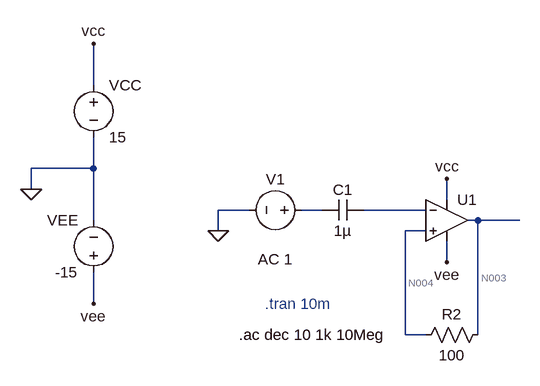
[diagram p0: schematic Opamp with capacitive load unstable sys.asc]
Opamp with capacitive load unstable sys.asc, the LTspice schematic file:
Version 4.1
SHEET 1 880 680
WIRE -352 -64 -352 -128
WIRE -352 64 -352 16
WIRE -352 64 -448 64
WIRE -448 96 -448 64
WIRE 192 112 192 80
WIRE -112 128 -160 128
WIRE 0 128 -32 128
WIRE 160 128 64 128
WIRE -352 144 -352 64
WIRE 240 144 224 144
WIRE 304 144 240 144
WIRE -160 160 -160 128
WIRE 160 160 128 160
WIRE 192 208 192 176
WIRE -352 272 -352 224
WIRE 128 320 128 160
WIRE 160 320 128 320
WIRE 240 320 240 144
FLAG -448 96 0
FLAG -352 -128 vcc
FLAG -352 272 vee
FLAG 192 80 vcc
FLAG 192 208 vee
FLAG -160 160 0
SYMBOL OpAmps\\UniversalOpAmp 192 144 R0
SYMATTR InstName U1
SYMBOL voltage -352 -80 R0
WINDOW 123 0 0 Left 0
WINDOW 39 0 0 Left 0
SYMATTR InstName VCC
SYMATTR Value 15
SYMBOL voltage -352 240 R180
WINDOW 0 24 96 Left 2
WINDOW 3 24 16 Left 2
WINDOW 123 0 0 Left 0
WINDOW 39 0 0 Left 0
SYMATTR InstName VEE
SYMATTR Value -15
SYMBOL res 256 304 R90
WINDOW 0 0 56 VBottom 2
WINDOW 3 32 56 VTop 2
SYMATTR InstName R2
SYMATTR Value 100
SYMBOL cap 64 112 R90
WINDOW 0 0 32 VBottom 2
WINDOW 3 32 32 VTop 2
SYMATTR InstName C1
SYMATTR Value 1µ
SYMBOL voltage -16 128 R90
WINDOW 0 -32 56 VBottom 2
WINDOW 3 32 56 VTop 2
WINDOW 123 60 56 VTop 2
WINDOW 39 0 0 Left 0
SYMATTR InstName V1
SYMATTR Value ""
SYMATTR Value2 AC 1
TEXT -88 272 Left 2 ;.tran 10m
TEXT -128 320 Left 2 !.ac dec 10 1k 10Meg

The netlist it stands for:
* Opamp with capacitive load unstable sys.asc
X§U1 N004 N002 vcc vee N003 level1 Avol=1Meg GBW=10Meg Vos=0 En=0 Enk=0 In=0 Ink=0 Rin=500Meg  ; pins In+ In- V+ V- OUT
VCC vcc 0 15
VEE vee 0 -15
R2 N003 N004 100
C1 N002 N001 1µ
V1 N001 0 AC 1
* .tran 10m
.ac dec 10 1k 10Meg
.lib UniversalOpAmp1.lib
.backanno
.end

* Results of the author's LTspice run, read from the files saved beside the schematic
* Operating Point, zero values left out:
*   V(vcc) = 15 V
*   V(vee) = -15 V
*   I(VCC) = -30 nA
*   I(VEE) = 30 nA
*   Ix(u1:3) = 30 nA
*   Ix(u1:4) = -30 nA
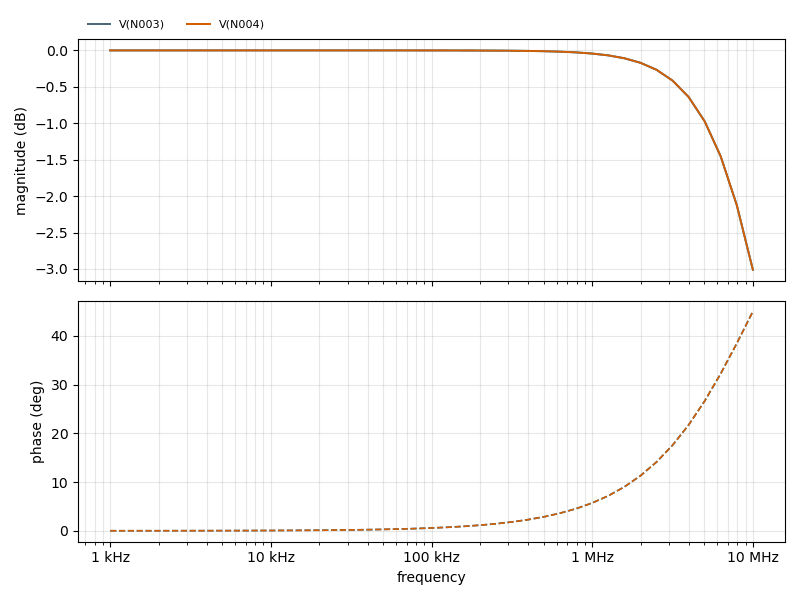
[diagram p1: AC Analysis of Opamp with capacitive load unstable sys.asc, plotted from the saved traces]
* AC Analysis, 1 run:
*   V(N003): 0.00 dB at 1 kHz, -3.01 dB at 10 MHz, peak 0.00 dB at 1 kHz, 3 dB below the peak at 10 MHz
*   V(N004): 0.00 dB at 1 kHz, -3.01 dB at 10 MHz, peak 0.00 dB at 1 kHz, 3 dB below the peak at 10 MHz